# Altium schematic sheet LTE_1.SchDoc
size 420 x 297 mm; SheetNumber: 10; SheetTotal: 12
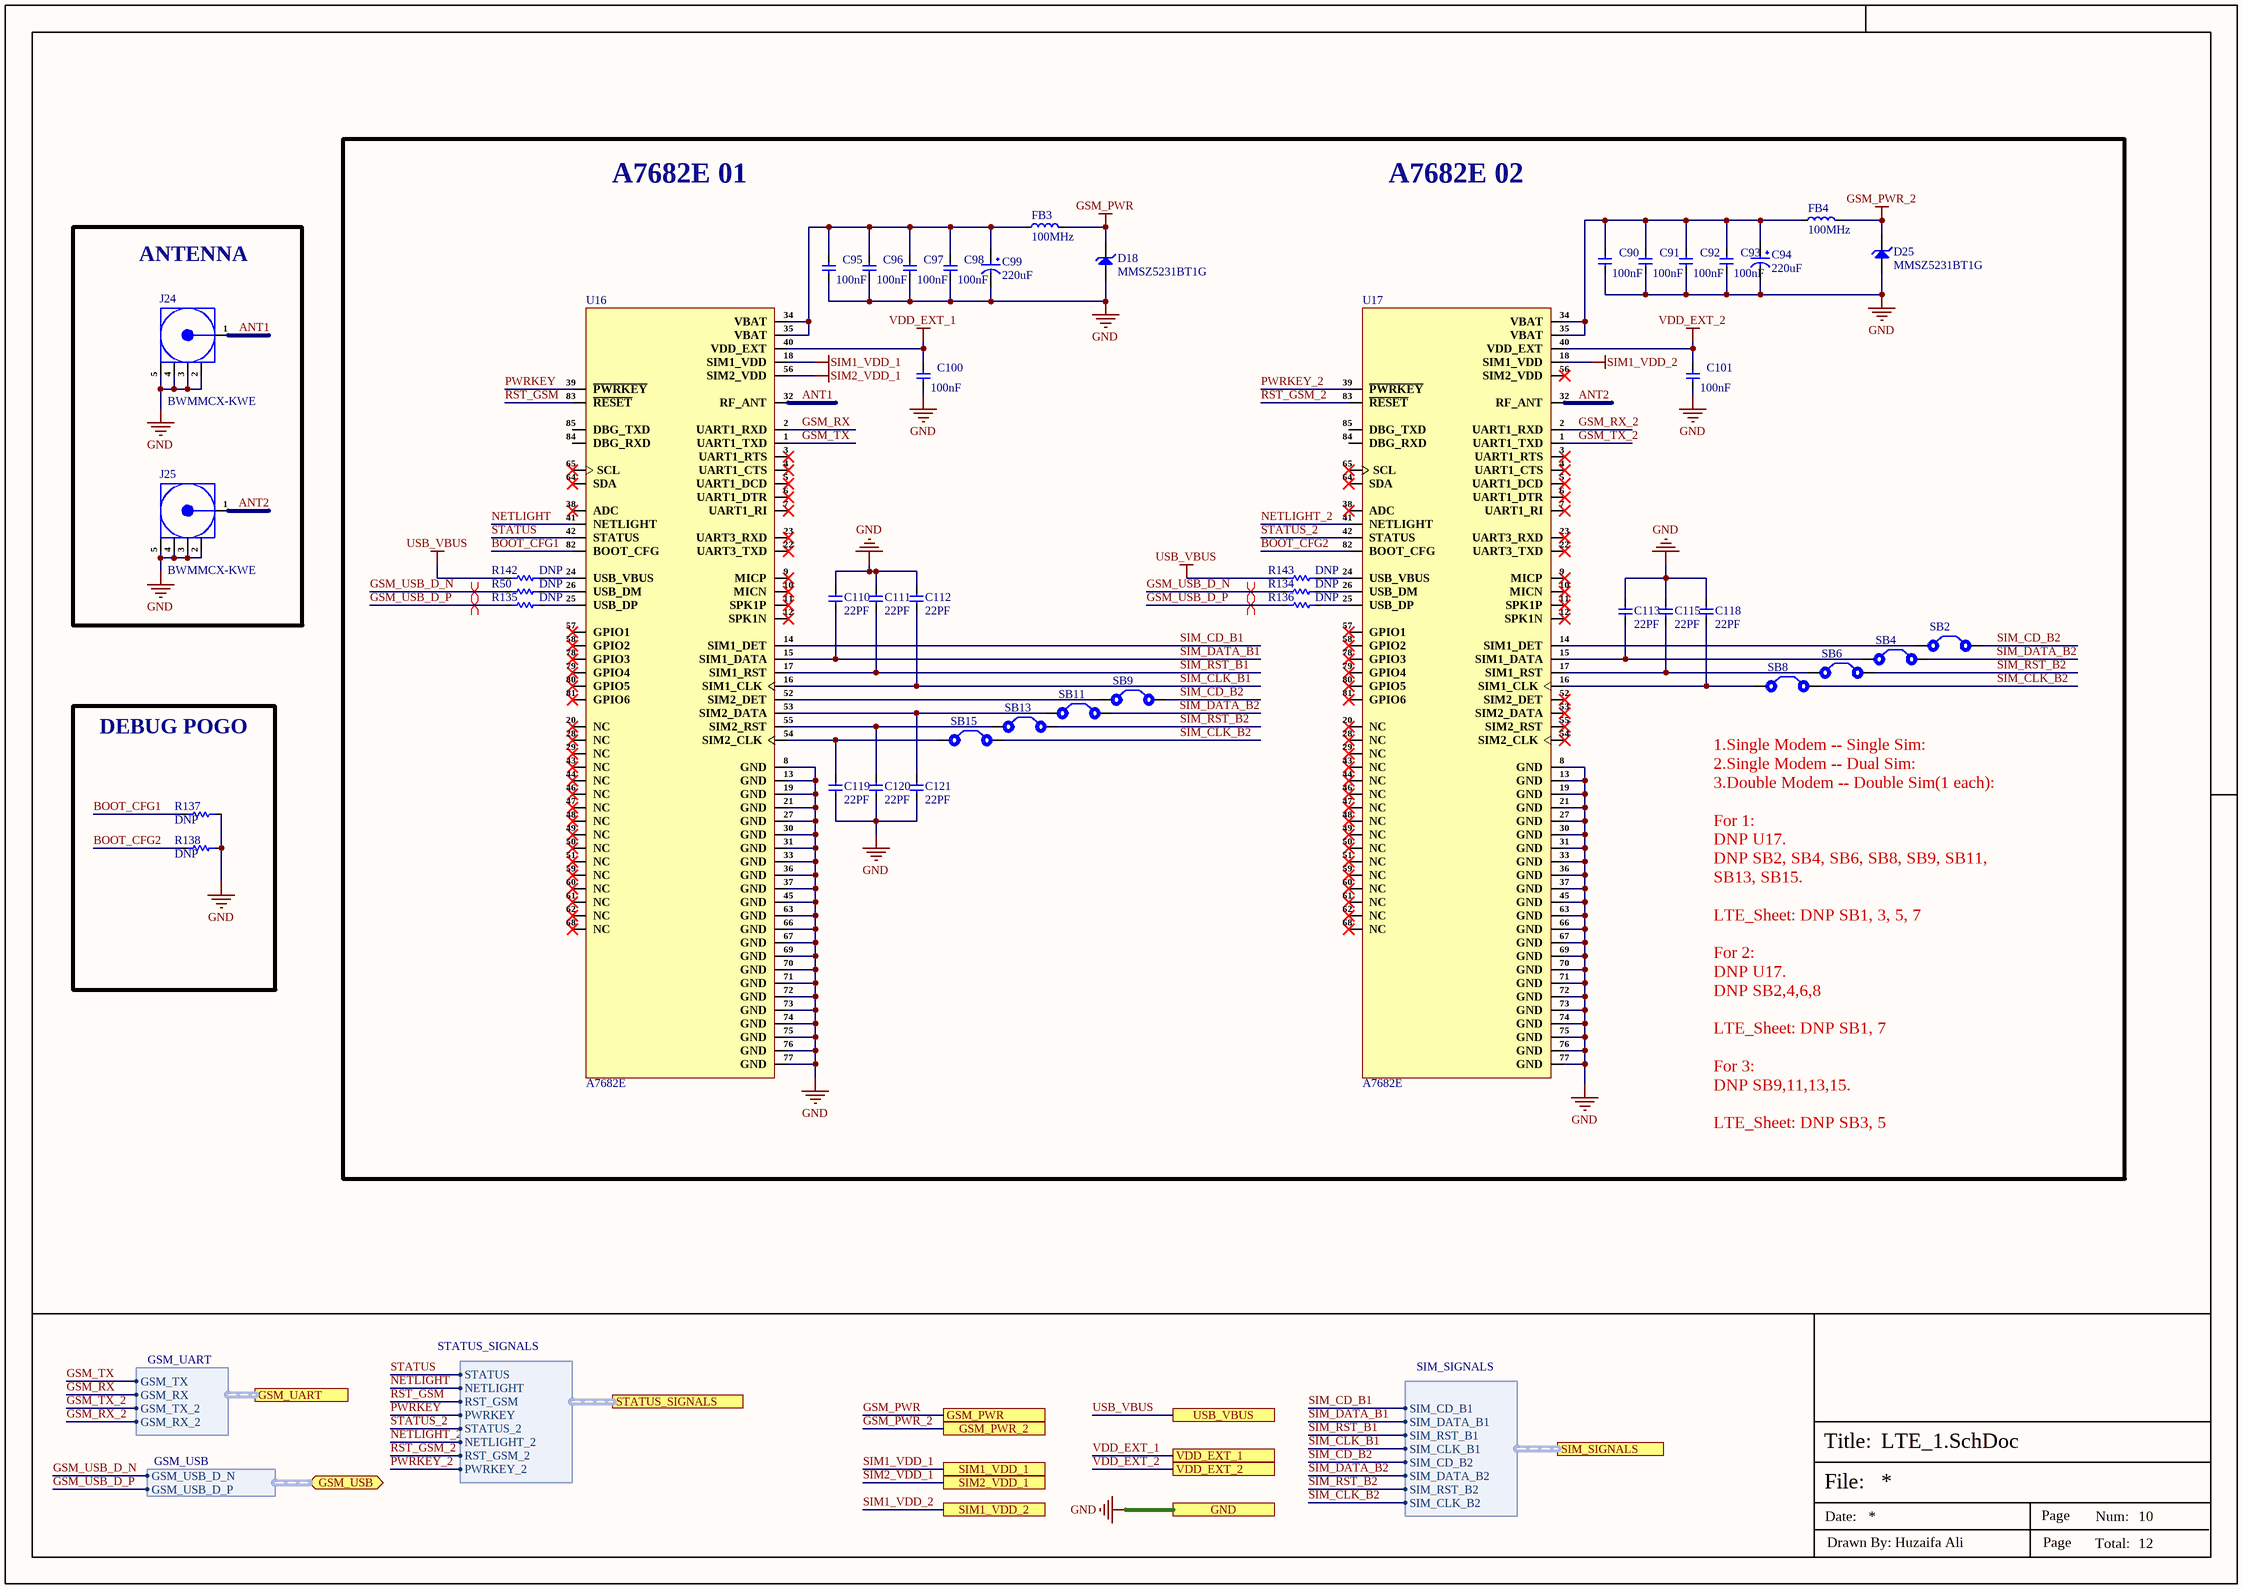
[diagram p0: LTE_1.SchDoc]

## Parts
C90  100nF  [CAP-0201]
C91  100nF  [CAP-0201]
C92  100nF  [CAP-0201]
C93  100nF  [CAP-0201]
C94  220uF  [Case-D]
C95  100nF  [CAP-0201]
C96  100nF  [CAP-0201]
C97  100nF  [CAP-0201]
C98  100nF  [CAP-0201]
C99  220uF  [Case-D]
C100  100nF  [CAP-0201]
C101  100nF  [CAP-0201]
C110  22PF  [Cap-0402]
C111  22PF  [Cap-0402]
C112  22PF  [Cap-0402]
C113  22PF  [Cap-0402]
C115  22PF  [Cap-0402]
C118  22PF  [Cap-0402]
C119  22PF  [Cap-0402]
C120  22PF  [Cap-0402]
C121  22PF  [Cap-0402]
D18  MMSZ5231BT1G  [SOD-123]
D25  MMSZ5231BT1G  [SOD-123]
FB3  100MHz  [Ind-0805]
FB4  100MHz  [Ind-0805]
J24  BWMMCX-KWE  [BWMMCX-KWE]
J25  BWMMCX-KWE  [BWMMCX-KWE]
R50  DNP  [Res-0402]
R134  DNP  [Res-0402]
R135  DNP  [Res-0402]
R136  DNP  [Res-0402]
R137  DNP  [Res-0402]
R138  DNP  [Res-0402]
R142  DNP  [Res-0402]
R143  DNP  [Res-0402]
SB2  Solder Bridge 0603  [Solder Bridge]  (value not drawn)  (no BOM)
SB4  Solder Bridge 0603  [Solder Bridge]  (value not drawn)  (no BOM)
SB6  Solder Bridge 0603  [Solder Bridge]  (value not drawn)  (no BOM)
SB8  Solder Bridge 0603  [Solder Bridge]  (value not drawn)  (no BOM)
SB9  Solder Bridge 0603  [Solder Bridge]  (value not drawn)  (no BOM)
SB11  Solder Bridge 0603  [Solder Bridge]  (value not drawn)  (no BOM)
SB13  Solder Bridge 0603  [Solder Bridge]  (value not drawn)  (no BOM)
SB15  Solder Bridge 0603  [Solder Bridge]  (value not drawn)  (no BOM)
U16  A7682E  [A7682E]
U17  A7682E  [A7682E]

## Blocks framed on the sheet
ANTENNA: J24 J25
DEBUG POGO: R137 R138

## Ports
GND, GSM_PWR, GSM_PWR_2, GSM_UART (harness GSM_UART), GSM_USB (bidir, harness GSM_USB), SIM1_VDD_1, SIM1_VDD_2, SIM2_VDD_1, SIM_SIGNALS (harness SIM_SIGNALS), STATUS_SIGNALS (harness STATUS_SIGNALS), USB_VBUS, VDD_EXT_1, VDD_EXT_2

## Harnesses
SIM_SIGNALS: SIM_CD_B1, SIM_DATA_B1, SIM_RST_B1, SIM_CLK_B1, SIM_CD_B2, SIM_DATA_B2, SIM_RST_B2, SIM_CLK_B2
STATUS_SIGNALS: NETLIGHT, STATUS, RST_GSM, PWRKEY, NETLIGHT_2, STATUS_2, RST_GSM_2, PWRKEY_2
GSM_UART: GSM_TX, GSM_RX, GSM_TX_2, GSM_RX_2
GSM_USB: GSM_USB_D_N, GSM_USB_D_P

## Nets
GND: C90.1 C91.1 C92.1 C93.1 C94.2 C95.1 C96.1 C97.1 C98.1 C99.2 C100.1 C101.1 C110.2 C111.2 C112.2 C113.1 C115.1 C118.1 C119.1 C120.1 C121.1 D18.1(A) D25.1(A) J24.2(GND) J24.3(GND) J24.4(GND) J24.5(GND) J25.2(GND) J25.3(GND) J25.4(GND) J25.5(GND) R137.2 R138.2 U16.8(GND) U16.13(GND) U16.19(GND) U16.21(GND) U16.27(GND) U16.30(GND) U16.31(GND) U16.33(GND) U16.36(GND) U16.37(GND) U16.45(GND) U16.63(GND) U16.66(GND) U16.67(GND) U16.69(GND) U16.70(GND) U16.71(GND) U16.72(GND) U16.73(GND) U16.74(GND) U16.75(GND) U16.76(GND) U16.77(GND) U17.8(GND) U17.13(GND) U17.19(GND) U17.21(GND) U17.27(GND) U17.30(GND) U17.31(GND) U17.33(GND) U17.36(GND) U17.37(GND) U17.45(GND) U17.63(GND) U17.66(GND) U17.67(GND) U17.69(GND) U17.70(GND) U17.71(GND) U17.72(GND) U17.73(GND) U17.74(GND) U17.75(GND) U17.76(GND) U17.77(GND) ; port GND
GSM_PWR: D18.2(K) FB3.2 ; port GSM_PWR
GSM_PWR_2: D25.2(K) FB4.2 ; port GSM_PWR_2
SIM1_VDD_1: U16.18(SIM1_VDD) ; port SIM1_VDD_1
SIM1_VDD_2: U17.18(SIM1_VDD) ; port SIM1_VDD_2
SIM2_VDD_1: U16.56(SIM2_VDD) ; port SIM2_VDD_1
USB_VBUS: R142.1 R143.1 ; port USB_VBUS
VDD_EXT_1: C100.2 U16.40(VDD_EXT) ; port VDD_EXT_1
VDD_EXT_2: C101.2 U17.40(VDD_EXT) ; port VDD_EXT_2
ANT1: J24.1(Signal) U16.32(RF_ANT)
ANT2: J25.1(Signal) U17.32(RF_ANT)
BOOT_CFG1: R137.1 U16.82(BOOT_CFG)
BOOT_CFG2: R138.1 U17.82(BOOT_CFG)
GSM_RX: U16.2(UART1_RXD) ; port GSM_UART.GSM_RX
GSM_RX_2: U17.2(UART1_RXD) ; port GSM_UART.GSM_RX_2
GSM_TX: U16.1(UART1_TXD) ; port GSM_UART.GSM_TX
GSM_TX_2: U17.1(UART1_TXD) ; port GSM_UART.GSM_TX_2
GSM_USB_D_N: R50.1 R134.1 ; port GSM_USB.GSM_USB_D_N
GSM_USB_D_P: R135.1 R136.1 ; port GSM_USB.GSM_USB_D_P
NETLIGHT: U16.41(NETLIGHT) ; port STATUS_SIGNALS.NETLIGHT
NETLIGHT_2: U17.41(NETLIGHT) ; port STATUS_SIGNALS.NETLIGHT_2
PWRKEY: U16.39(~{PWRKEY}) ; port STATUS_SIGNALS.PWRKEY
PWRKEY_2: U17.39(~{PWRKEY}) ; port STATUS_SIGNALS.PWRKEY_2
RST_GSM: U16.83(~{RESET}) ; port STATUS_SIGNALS.RST_GSM
RST_GSM_2: U17.83(~{RESET}) ; port STATUS_SIGNALS.RST_GSM_2
SIM_CD_B1: U16.14(SIM1_DET) ; port SIM_SIGNALS.SIM_CD_B1
SIM_CD_B2: SB2.2 SB9.2 ; port SIM_SIGNALS.SIM_CD_B2
SIM_CLK_B1: C112.1 U16.16(SIM1_CLK) ; port SIM_SIGNALS.SIM_CLK_B1
SIM_CLK_B2: SB8.2 SB15.2 ; port SIM_SIGNALS.SIM_CLK_B2
SIM_DATA_B1: C110.1 U16.15(SIM1_DATA) ; port SIM_SIGNALS.SIM_DATA_B1
SIM_DATA_B2: SB4.2 SB11.2 ; port SIM_SIGNALS.SIM_DATA_B2
SIM_RST_B1: C111.1 U16.17(SIM1_RST) ; port SIM_SIGNALS.SIM_RST_B1
SIM_RST_B2: SB6.2 SB13.2 ; port SIM_SIGNALS.SIM_RST_B2
STATUS: U16.42(STATUS) ; port STATUS_SIGNALS.STATUS
STATUS_2: U17.42(STATUS) ; port STATUS_SIGNALS.STATUS_2
NetC90_2: C90.2 C91.2 C92.2 C93.2 C94.1 FB4.1 U17.34(VBAT) U17.35(VBAT)
NetC95_2: C95.2 C96.2 C97.2 C98.2 C99.1 FB3.1 U16.34(VBAT) U16.35(VBAT)
NetC113_2: C113.2 SB4.1 U17.15(SIM1_DATA)
NetC115_2: C115.2 SB6.1 U17.17(SIM1_RST)
NetC118_2: C118.2 SB8.1 U17.16(SIM1_CLK)
NetC119_2: C119.2 SB15.1 U16.54(SIM2_CLK)
NetC120_2: C120.2 SB13.1 U16.55(SIM2_RST)
NetC121_2: C121.2 SB11.1 U16.53(SIM2_DATA)
NetR50_2: R50.2 U16.26(USB_DM)
NetR134_2: R134.2 U17.26(USB_DM)
NetR135_2: R135.2 U16.25(USB_DP)
NetR136_2: R136.2 U17.25(USB_DP)
NetR142_2: R142.2 U16.24(USB_VBUS)
NetR143_2: R143.2 U17.24(USB_VBUS)
NetSB2_1: SB2.1 U17.14(SIM1_DET)
NetSB9_1: SB9.1 U16.52(SIM2_DET)

Not connected (* = marked no-connect by the designer): U16 3(UART1_RTS)* 4(UART1_CTS)* 5(UART1_DCD)* 6(UART1_DTR)* 7(UART1_RI)* 9(MICP)* 10(MICN)* 11(SPK1P)* 12(SPK1N)* 20(NC)* 22(UART3_TXD)* 23(UART3_RXD)* 28(NC)* 29(NC)* 38(ADC)* 43(NC)* 44(NC)* 46(NC)* 47(NC)* 48(NC)* 49(NC)* 50(NC)* 51(NC)* 57(GPIO1)* 58(GPIO2)* 59(NC)* 60(NC)* 61(NC)* 62(NC)* 64(SDA)* 65(SCL)* 68(NC)* 78(GPIO3)* 79(GPIO4)* 80(GPIO5)* 81(GPIO6)* 84(DBG_RXD) 85(DBG_TXD); U17 3(UART1_RTS)* 4(UART1_CTS)* 5(UART1_DCD)* 6(UART1_DTR)* 7(UART1_RI)* 9(MICP)* 10(MICN)* 11(SPK1P)* 12(SPK1N)* 20(NC)* 22(UART3_TXD)* 23(UART3_RXD)* 28(NC)* 29(NC)* 38(ADC)* 43(NC)* 44(NC)* 46(NC)* 47(NC)* 48(NC)* 49(NC)* 50(NC)* 51(NC)* 52(SIM2_DET)* 53(SIM2_DATA)* 54(SIM2_CLK)* 55(SIM2_RST)* 56(SIM2_VDD)* 57(GPIO1)* 58(GPIO2)* 59(NC)* 60(NC)* 61(NC)* 62(NC)* 64(SDA)* 65(SCL)* 68(NC)* 78(GPIO3)* 79(GPIO4)* 80(GPIO5)* 81(GPIO6)* 84(DBG_RXD) 85(DBG_TXD)

## Layout directives
differential pair; net class GSM_USB; differential pair class GSM_USB_Lines; rule Impedance Constraint [Min = 88.00    Max = 90.00    ]; rule Matched Net Lengths [Tolerance = 20mil]: GSM_USB_D_N, GSM_USB_D_P

## Notes on the sheet
- A7682E 01
- A7682E 02
- 1.Single Modem -- Single Sim:
  2.Single Modem -- Dual Sim:
  3.Double Modem -- Double Sim(1 each):
  For 1:
  DNP U17.
  DNP SB2, SB4, SB6, SB8, SB9, SB11, SB13, SB15.
  LTE_Sheet: DNP SB1, 3, 5, 7
  For 2:
  DNP U17.
  DNP SB2,4,6,8
  LTE_Sheet: DNP SB1, 7
  For 3:
  DNP SB9,11,13,15.
  LTE_Sheet: DNP SB3, 5
- File:
- Title:
- Date:
- Page
- Num:
- Total:
- Drawn By: Huzaifa Ali

## Library data of the parts
C90-C93 C95-C98 C100 C101 = CC0201KRX5R6BB104: CAP CER 0.1UF 10V X5R 0201; Manufacturer: Yageo; Tolerance: 10%; Supplier 1: Mouser; Manufacturer Part Number: CC0201KRX5R6BB104; RoHS: Yes; Category: Ceramic Capacitors; Stock 1: 824403; Pricing 1: 1=0.10000, 10=0.02400, 50=0.02400, 100=0.01900, 1000=0.01100, 10000=0.00900 (USD); Mount: Surface Mount; Case/Package: 0201; Case Code (Imperial): 0201; Case Code (Metric): 0603; Weight: 6E-06oz; Min Operating Temperature: -55°C; Max Operating Temperature: 85°C; Capacitance: 100nF; Dielectric: X5R; Voltage Rating (DC): 10V; Packaging: Tape and Reel; Termination: SMD/SMT; Resistor Type: Ceramic; Voltage Rating: 10V; Series: CC; Construction: Flat; Length: 0.6mm; Width: 0.012inch; Height: 0.3mm; Thickness: 0.013inch; Depth: 0.3mm; Radiation Hardening: No; Lead Free: Lead Free; Halogen Free: Halogen Free; RoHS Compliant: Yes; ComponentLink1URL: https://datasheet.ciiva.com/11587/upy-gphc-x5r-4v-to-50v-12-11587190.pdf?src-supplier=Avnet; ComponentLink1Description: https://datasheet.ciiva.com/11587/upy-gphc-x5r-4v-to-50v-12-11587190.pdf?src-supplier=Avnet; Supplier Part Number 1: 603-CC201KRX5R6BB104; LCSC Part Number: C190183
C94 C99 = TAJD227K010RNJ: CAP TANT 220UF 10% 10V 2917; Manufacturer: Kyocera AVX; Item Type: Capacitor; Supplier: Rs; Supplier Part Number: 1349925; Manufacturer Part Number: TAJD227K010RNJ; RoHS: Yes; Category: Tantalum Capacitors; Stock: 100; Pricing: 500=0.553, 2500=0.537, 5000=0.523 (GBP); ComponentLink1URL: https://datasheet.ciiva.com/11793/0900766b80ccdc61-11793083.pdf?src-supplier=Rs; ComponentLink1Description: https://datasheet.ciiva.com/11793/0900766b80ccdc61-11793083.pdf?src-supplier=Rs; ComponentLink2URL: https://datasheet.ciiva.com/3004/taj-3004530.pdf?src-supplier=Avnet; ComponentLink2Description: https://datasheet.ciiva.com/3004/taj-3004530.pdf?src-supplier=Avnet; ComponentLink3URL: https://datasheet.ciiva.com/3004/taj-3004531.pdf?src-supplier=Avnet; ComponentLink3Description: https://datasheet.ciiva.com/3004/taj-3004531.pdf?src-supplier=Avnet; ComponentLink4URL: https://datasheet.ciiva.com/264/taj-264391.pdf?src-supplier=Digi-Key; ComponentLink4Description: https://datasheet.ciiva.com/264/taj-264391.pdf?src-supplier=Digi-Key; ComponentLink5URL: https://datasheet.ciiva.com/264/taj-264392.pdf?src-supplier=Digi-Key; ComponentLink5Description: https://datasheet.ciiva.com/264/taj-264392.pdf?src-supplier=Digi-Key; ComponentLink6URL: https://datasheet.ciiva.com/264/taj-264393.pdf?src-supplier=Digi-Key; ComponentLink6Description: https://datasheet.ciiva.com/264/taj-264393.pdf?src-supplier=Digi-Key; ComponentLink7URL: https://datasheet.ciiva.com/15163/getdatasheetpartid-121064-15163429.pdf?src-supplier=Verical; ComponentLink7Description: https://datasheet.ciiva.com/15163/getdatasheetpartid-121064-15163429.pdf?src-supplier=Verical; ComponentLink8URL: https://datasheet.ciiva.com/16201/taj-16201535.pdf?src-supplier=Future+Electronics; ComponentLink8Description: https://datasheet.ciiva.com/16201/taj-16201535.pdf?src-supplier=Future+Electronics; LCSC Part Number: C8024
C110-C113 C115 C118-C121 = CC0402JRNPO9BN220: CAP CER 22PF 50V C0G/NPO 0402; Manufacturer: Yageo; Dielectric Material: Ceramic; Tolerance: 5%; Dielectric: C0G; Temperature Coefficient: 30ppm/°C; Insulation Resistance: 100GR; Item Type: Capacitor; Supplier 1: Future Electronics; Manufacturer Part Number: CC0402JRNPO9BN220; RoHS: Yes; Category: Ceramic Capacitors; Stock 1: 200000; Pricing 1: 10000=0.00220, 40000=0.00210, 150000=0.00200, 400000=0.00190, 1000000=0.00180 (USD); Mounting Technology: Surface Mount; Case/Package: 0402; Pins: 2; Case Code (Metric): 1005; Case Code (Imperial): 0402; Min Operating Temperature: -55°C; Max Operating Temperature: 125°C; Value: 22pF; Voltage Rating: 50V; Packaging: Tape and Reel; Package Quantity: 1; Voltage Rating (DC): 50V; Termination: SMD/SMT; Resistor Type: Ceramic; Voltage: 50V; Series: CC; Length: 1mm; Width: 0.02inch; Height: 0.5mm; Thickness: 0.022inch; Depth: 0.5mm; Radiation Hardening: No; Reach SVHC Compliant: Yes; Lead Free: Lead Free; RoHS Compliant: Yes; ComponentLink1URL: https://datasheet.ciiva.com/5789/1443161-5789509.pdf?src-supplier=Farnell; ComponentLink1Description: https://datasheet.ciiva.com/5789/1443161-5789509.pdf?src-supplier=Farnell; ComponentLink2URL: https://datasheet.ciiva.com/8033/1443161-8033606.pdf?src-supplier=Element14; ComponentLink2Description: https://datasheet.ciiva.com/8033/1443161-8033606.pdf?src-supplier=Element14; ComponentLink3URL: https://datasheet.ciiva.com/7656/1132289-7656615.pdf?src-supplier=Element14; ComponentLink3Description: https://datasheet.ciiva.com/7656/1132289-7656615.pdf?src-supplier=Element14; ComponentLink4URL: https://datasheet.ciiva.com/8033/1443161-8033607.pdf?src-supplier=Element14; ComponentLink4Description: https://datasheet.ciiva.com/8033/1443161-8033607.pdf?src-supplier=Element14; ComponentLink5URL: https://datasheet.ciiva.com/8033/1443161-8033605.pdf?src-supplier=Element14; ComponentLink5Description: https://datasheet.ciiva.com/8033/1443161-8033605.pdf?src-supplier=Element14; ComponentLink6URL: https://datasheet.ciiva.com/143/mlccorderingcode-143987.pdf?src-supplier=Digi-Key; ComponentLink6Description: https://datasheet.ciiva.com/143/mlccorderingcode-143987.pdf?src-supplier=Digi-Key; ComponentLink7URL: https://datasheet.ciiva.com/143/mlccorderingcode-143986.pdf?src-supplier=Digi-Key; ComponentLink7Description: https://datasheet.ciiva.com/143/mlccorderingcode-143986.pdf?src-supplier=Digi-Key; ComponentLink8URL: https://datasheet.ciiva.com/143/mlccorderingcode-143988.pdf?src-supplier=Digi-Key; ComponentLink8Description: https://datasheet.ciiva.com/143/mlccorderingcode-143988.pdf?src-supplier=Digi-Key; ComponentLink9URL: https://datasheet.ciiva.com/5425/upy-gp-np0-16v-to-50v-8-5425483.pdf?src-supplier=Mouser; ComponentLink9Description: https://datasheet.ciiva.com/5425/upy-gp-np0-16v-to-50v-8-5425483.pdf?src-supplier=Mouser; ComponentLink10URL: https://datasheet.ciiva.com/15189/getdatasheetpartid-370074-15189117.pdf?src-supplier=Verical; ComponentLink10Description: https://datasheet.ciiva.com/15189/getdatasheetpartid-370074-15189117.pdf?src-supplier=Verical; Supplier Part Number 1: 9105957; LCSC Part Number: C106203
D18 D25 = MMSZ5231BT1G: DIODE ZENER 5.1V 500MW SOD123; Manufacturer: ON Semiconductor; Material: Plastic; Max Reverse Leakage Current: 5uA; Impedance: 17R; Tolerance: 5%; Zener Current: 10mA; Test Current: 20mA; Forward Voltage: 900mV; Breakdown Voltage: 5.36V; Supplier 1: Allied Electronics; Manufacturer Part Number: MMSZ5231BT1G; RoHS: Yes; Category: Zener Diodes; Case/Package: SOD-123-2; Pins: 2; Min Operating Temperature: -55°C; Max Operating Temperature: 150°C; Max Power Dissipation: 500mW; Packaging: Tape and Reel; Zener Voltage: 5.1V; Package Quantity: 3000; Series: Automotive, AEC-Q101; Voltage Tolerance: 5%; Power Dissipation: 500mW; Working Voltage: 5.1V; Max Reverse Current: 5uA; Voltage Rating (DC): 5.1V; Power Rating: 500mW; Length: 2.69mm; Width: 1.6mm; Height: 1.12mm; RoHS Compliant: Yes; Lead Free: Lead Free; Reach SVHC Compliant: No; ComponentLink1URL: https://datasheet.ciiva.com/23815/1708301-23815376.pdf?src-supplier=Newark; ComponentLink1Description: https://datasheet.ciiva.com/23815/1708301-23815376.pdf?src-supplier=Newark; ComponentLink2URL: https://datasheet.ciiva.com/22626/1708301-22626967.pdf?src-supplier=Element14; ComponentLink2Description: https://datasheet.ciiva.com/22626/1708301-22626967.pdf?src-supplier=Element14; ComponentLink3URL: https://datasheet.ciiva.com/4731/mmsz5221bt1-d-4731452.pdf?src-supplier=Mouser; ComponentLink3Description: https://datasheet.ciiva.com/4731/mmsz5221bt1-d-4731452.pdf?src-supplier=Mouser; ComponentLink4URL: https://datasheet.ciiva.com/16200/mmsz5221bt1-d-16200104.pdf?src-supplier=Future+Electronics; ComponentLink4Description: https://datasheet.ciiva.com/16200/mmsz5221bt1-d-16200104.pdf?src-supplier=Future+Electronics; ComponentLink5URL: https://datasheet.ciiva.com/894/mmsz5221bt1-d-894882.pdf?src-supplier=Digi-Key; ComponentLink5Description: https://datasheet.ciiva.com/894/mmsz5221bt1-d-894882.pdf?src-supplier=Digi-Key; ComponentLink6URL: https://datasheet.ciiva.com/894/mmsz5221bt1-d-894883.pdf?src-supplier=Digi-Key; ComponentLink6Description: https://datasheet.ciiva.com/894/mmsz5221bt1-d-894883.pdf?src-supplier=Digi-Key; ComponentLink7URL: https://datasheet.ciiva.com/894/mmsz5221bt1-d-894881.pdf?src-supplier=Digi-Key; ComponentLink7Description: https://datasheet.ciiva.com/894/mmsz5221bt1-d-894881.pdf?src-supplier=Digi-Key; Supplier Part Number 1: 70099546; LCSC Part Number: C66198; Item Type: Diode
FB3 FB4 = BLM21PG300SN1D: FERRITE BEAD 30 OHM 0805 1LN; Material: Steel,Ferrite; Value: 15mR; Tolerance: 25%; Impedance: 30R; Max Current Rating: 4A; Number of Lines: 1; DC Resistance (DCR): 14mR; Max DC Current: 3A; Shielding: Unshielded; LCSC Part Number: C16903; Item Type: Ferrite Bead; ComponentLink1Description: LCSC; Supplier: Rs; Supplier Part Number: 7241536P; RoHS: Yes; Category: Ferrite Beads and Chips; Stock: 11575; Pricing: 500=0.043, 1000=0.038, 2500=0.033, 5000=0.03 (GBP); Case/Package: 0805; Pins: 2; Core Material: Ferrite; Case Code (Metric): 2012; Case Code (Imperial): 0805; Min Operating Temperature: -55°C; Max Operating Temperature: 125°C; Package Quantity: 1; Packaging: Tape and Reel; Current Rating: 4A; Termination: SMD/SMT; Test Frequency: 100MHz; DC Current: 3A; Frequency: 100MHz; Number of Circuits: 1; Series: BLM21P; DC Resistance-Max: 14mR; RMS Current (Irms): 4A; ESR: 14mR; Length: 2mm; Width: 1.25mm; Height: 0.85mm; Depth: 1.25mm; Radiation Hardening: No; Reach SVHC Compliant: No; Military Standard: Not; Lead Free: Lead Free; RoHS Compliant: Yes; ComponentLink2URL: https://datasheet.ciiva.com/19460/1845339-19460237.pdf?src-supplier=Jameco; ComponentLink2Description: https://datasheet.ciiva.com/19460/1845339-19460237.pdf?src-supplier=Jameco; ComponentLink3URL: https://datasheet.ciiva.com/11795/0900766b80021a8e-11795584.pdf?src-supplier=Rs; ComponentLink3Description: https://datasheet.ciiva.com/11795/0900766b80021a8e-11795584.pdf?src-supplier=Rs; ComponentLink4URL: https://datasheet.ciiva.com/8021/1756152-8021599.pdf?src-supplier=Element14; ComponentLink4Description: https://datasheet.ciiva.com/8021/1756152-8021599.pdf?src-supplier=Element14; ComponentLink5URL: https://datasheet.ciiva.com/6212/l0110s0100blm21p-6212358.pdf?src-supplier=Digi-Key; ComponentLink5Description: https://datasheet.ciiva.com/6212/l0110s0100blm21p-6212358.pdf?src-supplier=Digi-Key; ComponentLink6URL: https://datasheet.ciiva.com/6212/l0110s0100blm21p-6212360.pdf?src-supplier=Digi-Key; ComponentLink6Description: https://datasheet.ciiva.com/6212/l0110s0100blm21p-6212360.pdf?src-supplier=Digi-Key; ComponentLink7URL: https://datasheet.ciiva.com/3081/l0110s0100blm21p-3081657.pdf?src-supplier=Avnet; ComponentLink7Description: https://datasheet.ciiva.com/3081/l0110s0100blm21p-3081657.pdf?src-supplier=Avnet; ComponentLink8URL: https://datasheet.ciiva.com/16199/l0110s0100blm21p-16199625.pdf?src-supplier=Future+Electronics; ComponentLink8Description: https://datasheet.ciiva.com/16199/l0110s0100blm21p-16199625.pdf?src-supplier=Future+Electronics; ComponentLink9URL: https://datasheet.ciiva.com/3081/l0110s0100blm21p-3081658.pdf?src-supplier=Avnet; ComponentLink9Description: https://datasheet.ciiva.com/3081/l0110s0100blm21p-3081658.pdf?src-supplier=Avnet; ComponentLink10URL: https://datasheet.ciiva.com/41449/001172365-da-01-en-drossel-0805-30r0-2-0x1-25mm-4000st-41449606.pdf?src-supplier=Conrad; ComponentLink10Description: https://datasheet.ciiva.com/41449/001172365-da-01-en-drossel-0805-30r0-2-0x1-25mm-4000st-41449606.pdf?src-supplier=Conrad
J24 J25 = BWMMCX-KWE: 1 Inner bore MCX/MMCX Board Edge Bend 6.8mm 6GHz 50Ω 3.45mm Plugin RF Connectors / Coaxial Connectors ROHS; Manufacturer: BAT WIRELESS; Manufacturer Part Number: BWMMCX-KWE; LCSC Part Number: C5137199; Item Type: Coaxial Connector; ComponentLink1Description: LCSC; ComponentLink1URL: https://www.lcsc.com/product-detail/RF-Connectors-Coaxial-Connectors_BAT-WIRELESS-BWMMCX-KWE_C5137199.html
R50 R134-R138 R142 R143 = RC0402FR-070RL: RES 0 OHM JUMPER 1/16W 0402; Manufacturer: Yageo; Resistance: 0R; Tolerance: 1%; Power Rating: 62.5mW; Voltage Rating: 50V; Temperature Coefficient: 200ppm/°C; Max Power Dissipation: 63mW; Supplier 1: Mouser; Manufacturer Part Number: RC0402FR-070RL; RoHS: Yes; Category: Chip SMD Resistors; Stock 1: 8556842; Pricing 1: 1=0.10000, 10=0.01400, 50=0.01400, 100=0.00600, 1000=0.00300, 5000=0.00200, 10000=0.00100 (USD); Mount: Surface Mount; Case/Package: 0402; Contact Plating: Tin,Matte; Case Code (Imperial): 0402; Case Code (Metric): 1005; Size Code: 0402; Min Operating Temperature: -55°C; Max Operating Temperature: 155°C; Resistor Type: Thick Film; Packaging: Tape and Reel; Termination: SMD/SMT; Features: Moisture Resistant; Series: RC; Number of Terminations: 2; Length: 1mm; Width: 0.5mm; Height: 0.35mm; Radiation Hardening: No; Lead Free: Lead Free; RoHS Compliant: Yes; ComponentLink1URL: https://datasheet.ciiva.com/8896/pyu-rc0402-51-rohs-l-6-8896149.pdf?src-supplier=Avnet; ComponentLink1Description: https://datasheet.ciiva.com/8896/pyu-rc0402-51-rohs-l-6-8896149.pdf?src-supplier=Avnet; ComponentLink2URL: https://datasheet.ciiva.com/16790/pyu-rc0402-51-rohs-l-6-r-16790444.pdf?src-supplier=Future+Electronics; ComponentLink2Description: https://datasheet.ciiva.com/16790/pyu-rc0402-51-rohs-l-6-r-16790444.pdf?src-supplier=Future+Electronics; Supplier Part Number 1: 603-RC0402FR-070RL; LCSC Part Number: C106231
SB2 SB4 SB6 SB8 SB9 SB11 SB13 SB15 = Solder Bridge 0603: Solder Bridge ON; Manufacturer Part Number: Solder Bridge; Item Type: Solder Bridge
U16 U17 = A7682E: LGA-85_19.6x19.6x1.10P RF Modules ROHS; Manufacturer: SIMCom Wireless Solutions; Item Type: Module; Manufacturer Part Number: A7682E; Package: LGA-85_19.6x19.6x1.10P; LCSC Part Number: C5362858; ComponentLink1Description: LCSC; ComponentLink1URL: https://www.lcsc.com/product-detail/RF-Modules_SIMCom-Wireless-Solutions-A7682E_C5362858.html